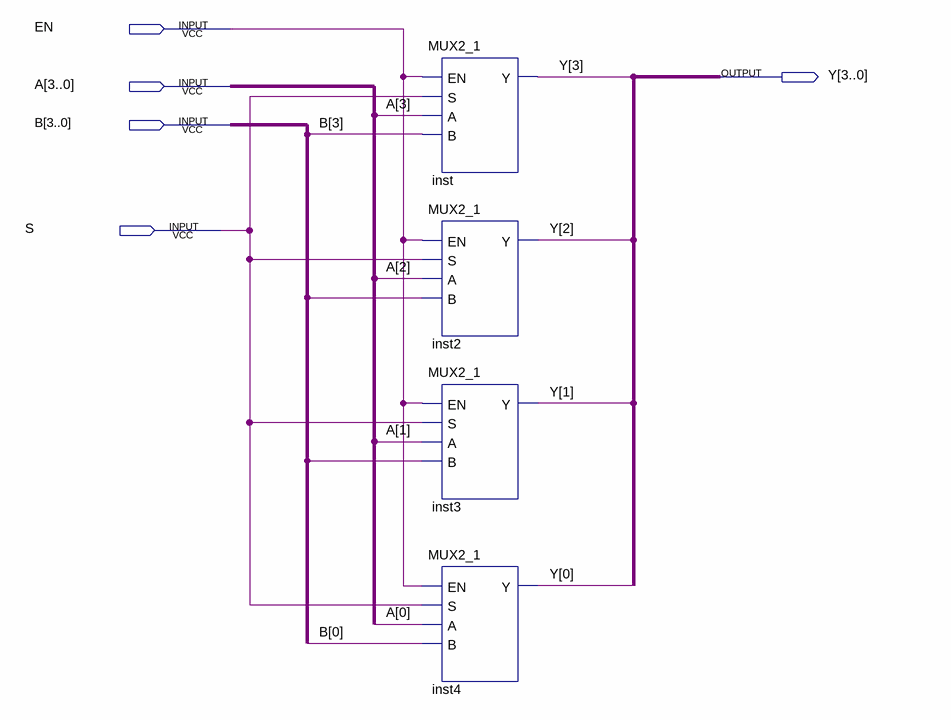
[diagram p0: schematic sheet]
// Quartus schematic MUX2_1_data_4_bit.bdf as structural Verilog: 4 symbols, 5 pins
module MUX2_1_data_4_bit (
  input  EN,
  input  [3:0] A,
  input  [3:0] B,
  input  S,
  output [3:0] Y
);

  wire undriven, undriven_2;

  MUX2_1 inst (.EN(EN), .S(S), .A(A[3]), .B(B[3]), .Y(Y[3]));
  MUX2_1 inst2 (.EN(EN), .S(S), .A(A[2]), .B(undriven_2), .Y(Y[2]));
  MUX2_1 inst3 (.EN(EN), .S(S), .A(A[1]), .B(undriven), .Y(Y[1]));
  MUX2_1 inst4 (.EN(EN), .S(S), .A(A[0]), .B(B[0]), .Y(Y[0]));
endmodule
